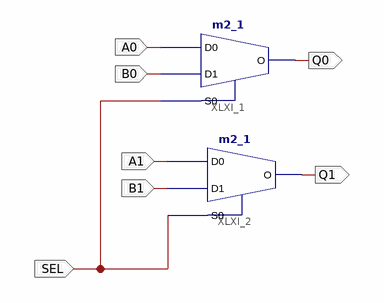
[diagram p0: schematic sheet 1]
// Xilinx ISE schematic MUX.sch (spartan3e) as structural Verilog: 2 symbols, 7 ports
module MUX (
  input  A0,
  input  B0,
  input  A1,
  input  B1,
  input  SEL,
  output Q0,
  output Q1
);

  m2_1 XLXI_1 (.D0(A0), .D1(B0), .S0(SEL), .O(Q0));
  m2_1 XLXI_2 (.D0(A1), .D1(B1), .S0(SEL), .O(Q1));
endmodule
